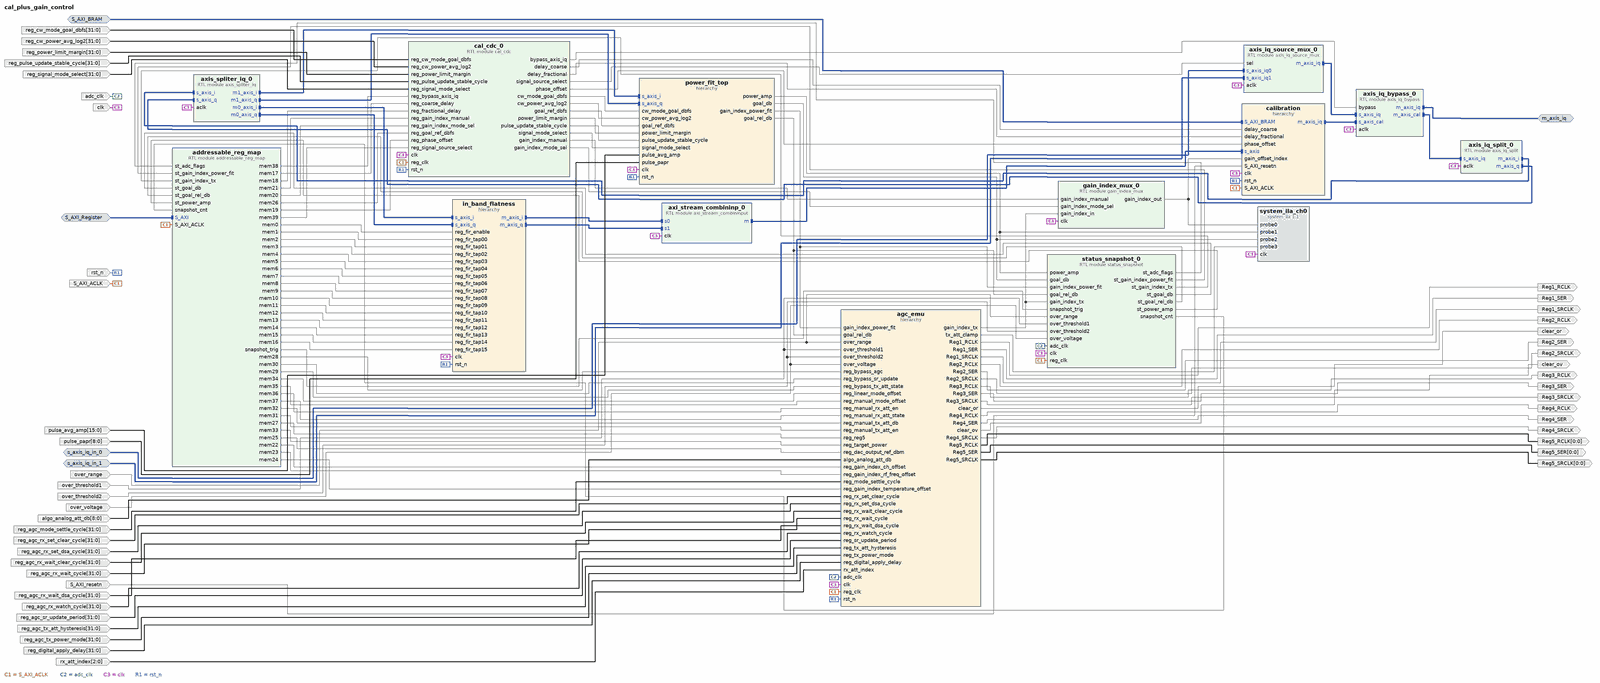
[diagram p0: block diagram of the top level, whole]
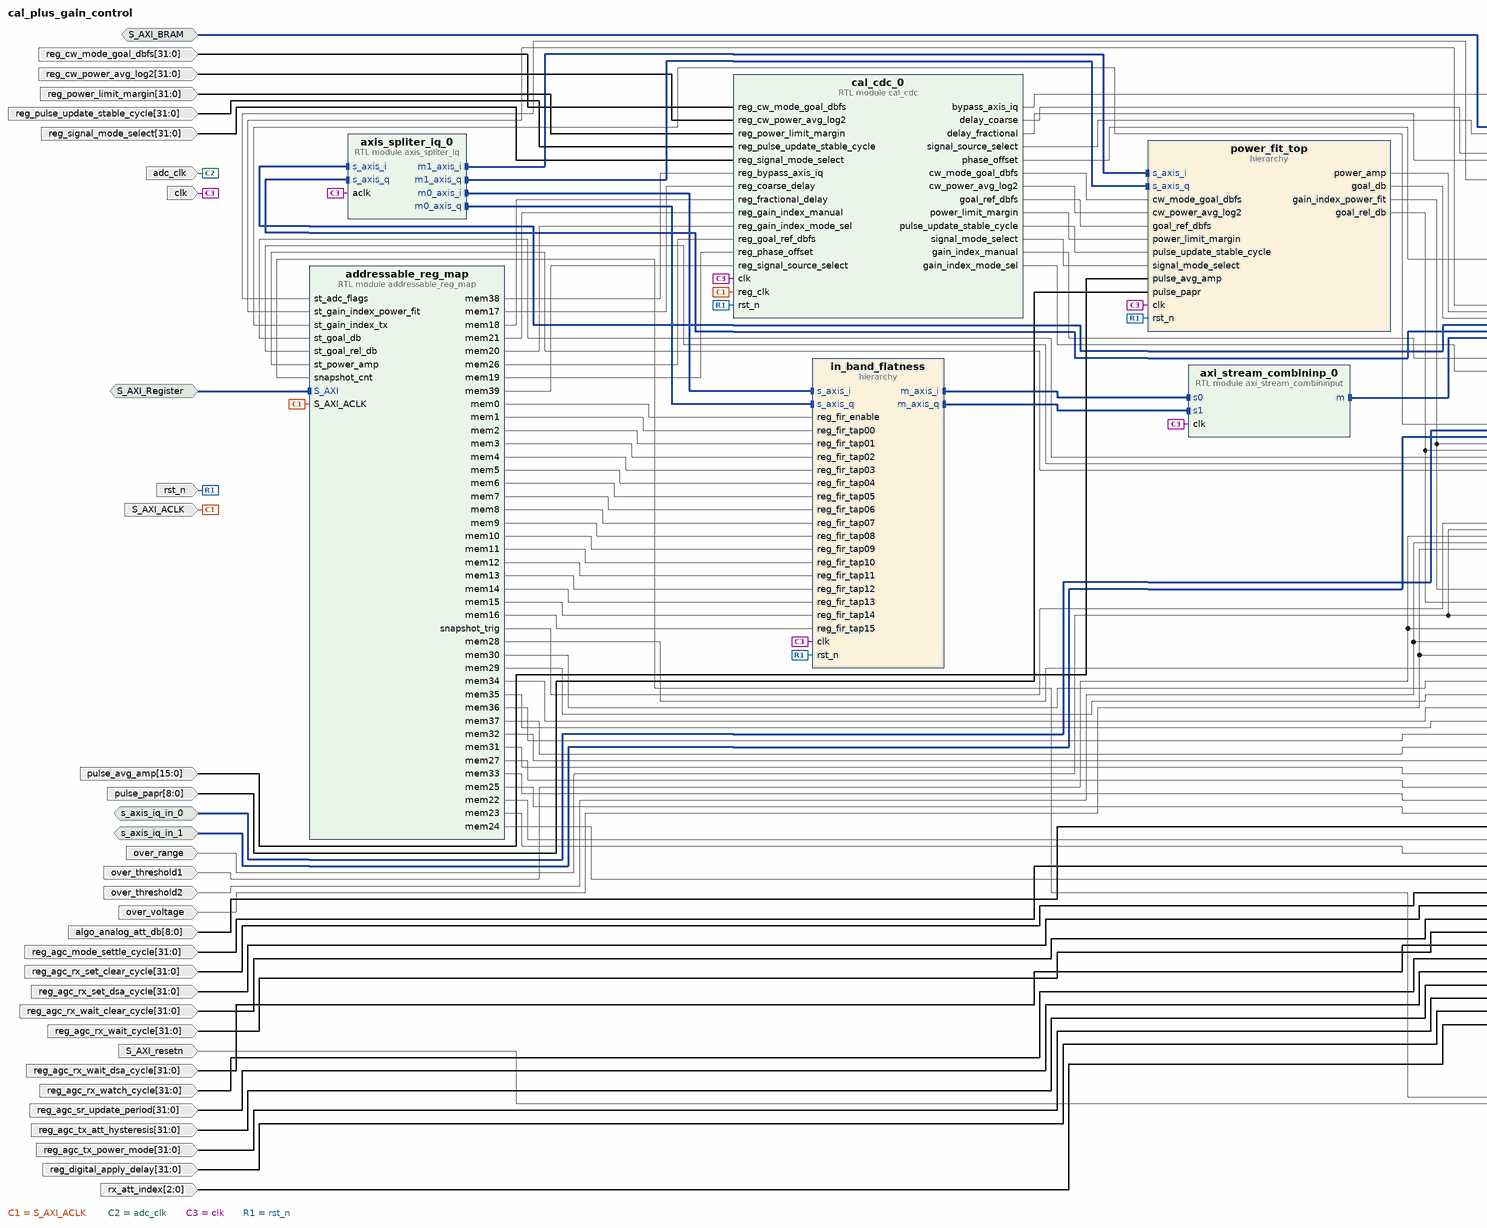
[diagram p1: block diagram of the top level, left part]
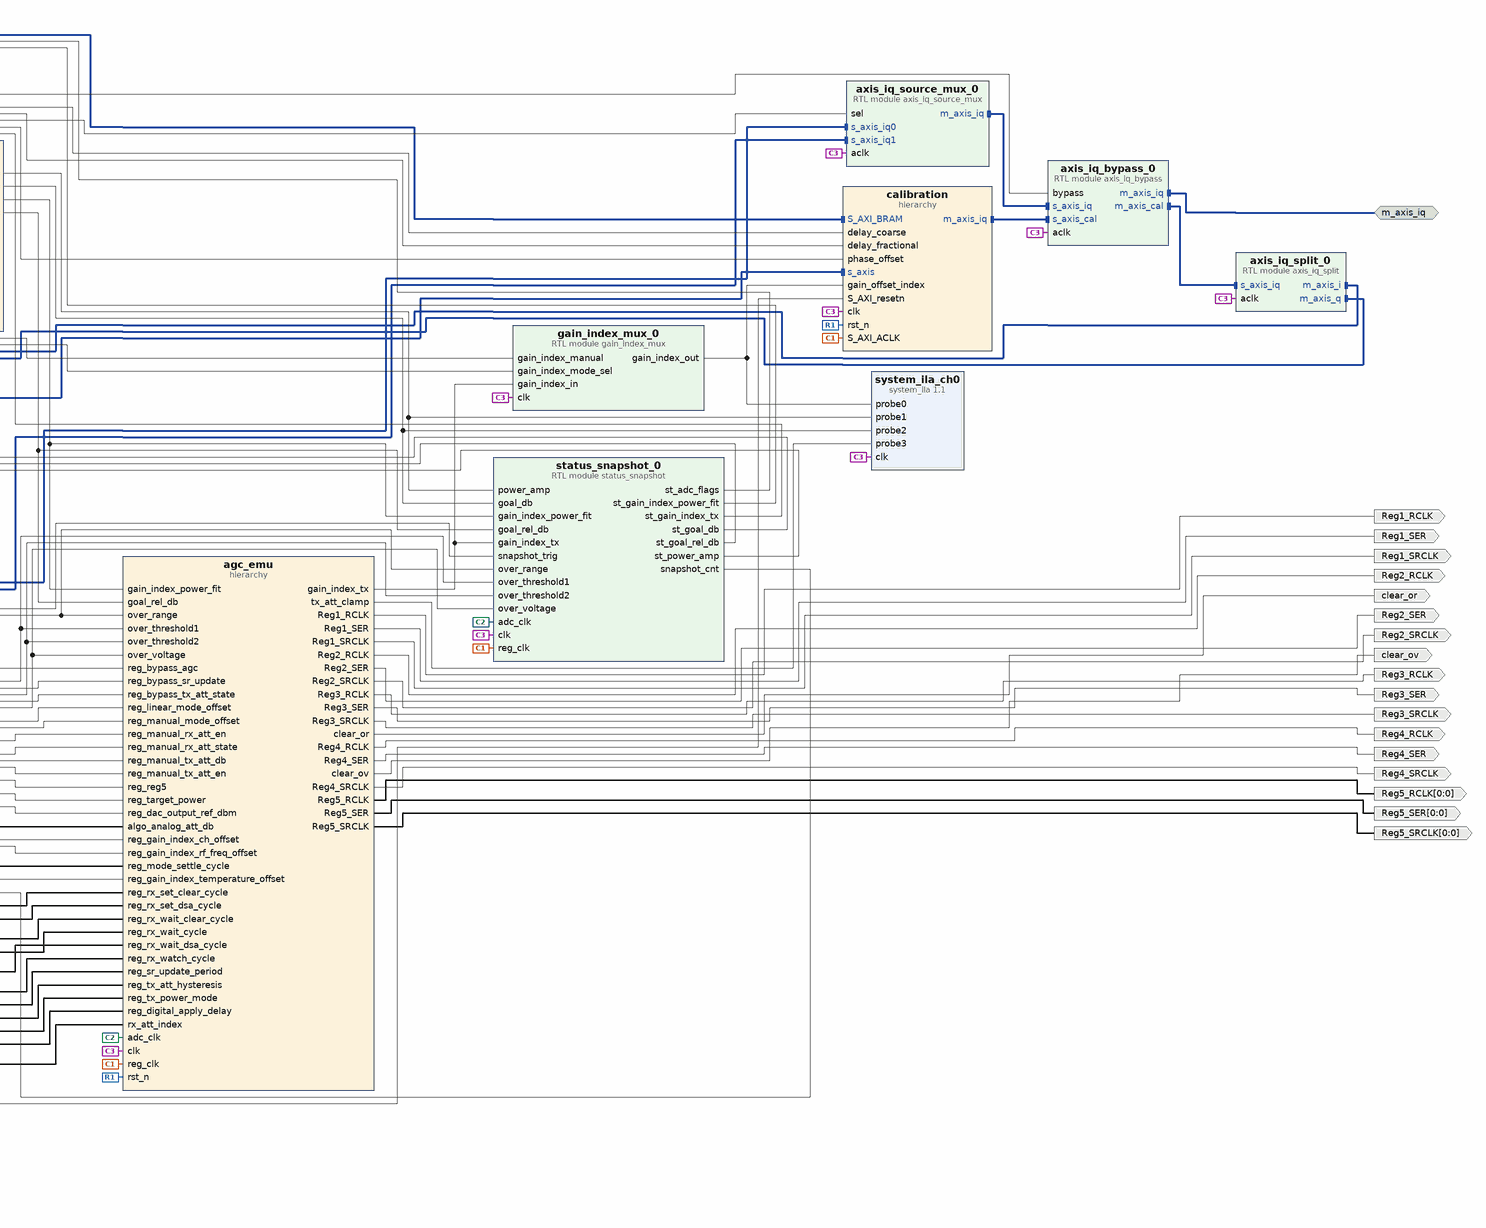
[diagram p2: block diagram of the top level, right part]
# Vivado block design cal_plus_gain_control, xczu47dr-ffvg1517-2-i, Vivado 2025.2
create_bd_design cal_plus_gain_control

create_bd_intf_port -mode Master -vlnv xilinx.com:interface:axis_rtl:1.0 m_axis_iq
set_property -dict {CONFIG.FREQ_HZ 256000000} [get_bd_intf_ports m_axis_iq]
create_bd_intf_port -mode Slave -vlnv xilinx.com:interface:aximm_rtl:1.0 S_AXI_Register
set_property -dict [list \
  CONFIG.ADDR_WIDTH 16 \
  CONFIG.ARUSER_WIDTH 0 \
  CONFIG.AWUSER_WIDTH 0 \
  CONFIG.BUSER_WIDTH 0 \
  CONFIG.DATA_WIDTH 32 \
  CONFIG.FREQ_HZ 99999901 \
  CONFIG.HAS_BRESP 1 \
  CONFIG.HAS_BURST 0 \
  CONFIG.HAS_CACHE 0 \
  CONFIG.HAS_LOCK 0 \
  CONFIG.HAS_PROT 1 \
  CONFIG.HAS_QOS 0 \
  CONFIG.HAS_REGION 0 \
  CONFIG.HAS_RRESP 1 \
  CONFIG.HAS_WSTRB 1 \
  CONFIG.ID_WIDTH 0 \
  CONFIG.NUM_READ_OUTSTANDING 1 \
  CONFIG.NUM_READ_THREADS 1 \
  CONFIG.NUM_WRITE_OUTSTANDING 1 \
  CONFIG.NUM_WRITE_THREADS 1 \
  CONFIG.PROTOCOL AXI4LITE \
  CONFIG.READ_WRITE_MODE READ_WRITE \
  CONFIG.RUSER_BITS_PER_BYTE 0 \
  CONFIG.RUSER_WIDTH 0 \
  CONFIG.WUSER_BITS_PER_BYTE 0 \
  CONFIG.WUSER_WIDTH 0 \
] [get_bd_intf_ports S_AXI_Register]
create_bd_intf_port -mode Slave -vlnv xilinx.com:interface:aximm_rtl:1.0 S_AXI_BRAM
set_property -dict [list \
  CONFIG.ADDR_WIDTH 15 \
  CONFIG.ARUSER_WIDTH 0 \
  CONFIG.AWUSER_WIDTH 0 \
  CONFIG.BUSER_WIDTH 0 \
  CONFIG.DATA_WIDTH 32 \
  CONFIG.FREQ_HZ 99999901 \
  CONFIG.HAS_BRESP 1 \
  CONFIG.HAS_BURST 1 \
  CONFIG.HAS_CACHE 1 \
  CONFIG.HAS_LOCK 1 \
  CONFIG.HAS_PROT 1 \
  CONFIG.HAS_QOS 0 \
  CONFIG.HAS_REGION 0 \
  CONFIG.HAS_RRESP 1 \
  CONFIG.HAS_WSTRB 1 \
  CONFIG.ID_WIDTH 0 \
  CONFIG.MAX_BURST_LENGTH 256 \
  CONFIG.NUM_READ_OUTSTANDING 2 \
  CONFIG.NUM_READ_THREADS 1 \
  CONFIG.NUM_WRITE_OUTSTANDING 2 \
  CONFIG.NUM_WRITE_THREADS 1 \
  CONFIG.PROTOCOL AXI4 \
  CONFIG.READ_WRITE_MODE READ_WRITE \
  CONFIG.RUSER_BITS_PER_BYTE 0 \
  CONFIG.RUSER_WIDTH 0 \
  CONFIG.SUPPORTS_NARROW_BURST 1 \
  CONFIG.WUSER_BITS_PER_BYTE 0 \
  CONFIG.WUSER_WIDTH 0 \
] [get_bd_intf_ports S_AXI_BRAM]
create_bd_intf_port -mode Slave -vlnv xilinx.com:interface:axis_rtl:1.0 s_axis_iq_in_0
set_property -dict [list \
  CONFIG.FREQ_HZ 256000000 \
  CONFIG.HAS_TKEEP 0 \
  CONFIG.HAS_TLAST 0 \
  CONFIG.HAS_TREADY 1 \
  CONFIG.HAS_TSTRB 0 \
  CONFIG.LAYERED_METADATA undef \
  CONFIG.TDATA_NUM_BYTES 20 \
  CONFIG.TDEST_WIDTH 0 \
  CONFIG.TID_WIDTH 0 \
  CONFIG.TUSER_WIDTH 0 \
] [get_bd_intf_ports s_axis_iq_in_0]
create_bd_intf_port -mode Slave -vlnv xilinx.com:interface:axis_rtl:1.0 s_axis_iq_in_1
set_property -dict [list \
  CONFIG.FREQ_HZ 256000000 \
  CONFIG.HAS_TKEEP 0 \
  CONFIG.HAS_TLAST 0 \
  CONFIG.HAS_TREADY 1 \
  CONFIG.HAS_TSTRB 0 \
  CONFIG.LAYERED_METADATA undef \
  CONFIG.TDATA_NUM_BYTES 20 \
  CONFIG.TDEST_WIDTH 0 \
  CONFIG.TID_WIDTH 0 \
  CONFIG.TUSER_WIDTH 0 \
] [get_bd_intf_ports s_axis_iq_in_1]
create_bd_port -dir I -type clk clk
set_property -dict [list \
  CONFIG.ASSOCIATED_BUSIF s_axis_iq_in_0:s_axis_iq_in_1:m_axis_iq \
  CONFIG.ASSOCIATED_RESET rst_n \
  CONFIG.FREQ_HZ 256000000 \
] [get_bd_ports clk]
create_bd_port -dir I -type rst rst_n
set_property -dict {CONFIG.POLARITY ACTIVE_LOW} [get_bd_ports rst_n]
create_bd_port -dir I -type clk S_AXI_ACLK
set_property -dict [list \
  CONFIG.ASSOCIATED_BUSIF S_AXI_Register:S_AXI_BRAM \
  CONFIG.ASSOCIATED_RESET S_AXI_resetn \
  CONFIG.FREQ_HZ 99999901 \
] [get_bd_ports S_AXI_ACLK]
create_bd_port -dir I -type rst S_AXI_resetn
set_property -dict {CONFIG.POLARITY ACTIVE_LOW} [get_bd_ports S_AXI_resetn]
create_bd_port -dir I over_voltage
create_bd_port -dir I over_range
create_bd_port -dir I over_threshold1
create_bd_port -dir I over_threshold2
create_bd_port -dir O clear_or
create_bd_port -dir O clear_ov
create_bd_port -dir O Reg1_SER
create_bd_port -dir O Reg1_SRCLK
create_bd_port -dir O Reg1_RCLK
create_bd_port -dir O Reg2_SER
create_bd_port -dir O Reg2_SRCLK
create_bd_port -dir O Reg2_RCLK
create_bd_port -dir O Reg3_SER
create_bd_port -dir O Reg3_SRCLK
create_bd_port -dir O Reg3_RCLK
create_bd_port -dir O Reg4_SER
create_bd_port -dir O Reg4_SRCLK
create_bd_port -dir O Reg4_RCLK
create_bd_port -dir O -from 0 -to 0 Reg5_SER
create_bd_port -dir O -from 0 -to 0 Reg5_SRCLK
create_bd_port -dir O -from 0 -to 0 Reg5_RCLK
create_bd_port -dir I -type clk adc_clk
set_property -dict {CONFIG.FREQ_HZ 240000000} [get_bd_ports adc_clk]
create_bd_port -dir I -from 2 -to 0 rx_att_index
create_bd_port -dir I -from 8 -to 0 algo_analog_att_db
create_bd_port -dir I -from 15 -to 0 pulse_avg_amp
create_bd_port -dir I -from 8 -to 0 pulse_papr
create_bd_port -dir I -from 31 -to 0 reg_signal_mode_select
create_bd_port -dir I -from 31 -to 0 reg_power_limit_margin
create_bd_port -dir I -from 31 -to 0 reg_cw_mode_goal_dbfs
create_bd_port -dir I -from 31 -to 0 reg_pulse_update_stable_cycle
create_bd_port -dir I -from 31 -to 0 reg_agc_tx_power_mode
create_bd_port -dir I -from 31 -to 0 reg_digital_apply_delay
create_bd_port -dir I -from 31 -to 0 reg_agc_sr_update_period
create_bd_port -dir I -from 31 -to 0 reg_agc_mode_settle_cycle
create_bd_port -dir I -from 31 -to 0 reg_agc_rx_watch_cycle
create_bd_port -dir I -from 31 -to 0 reg_agc_rx_wait_dsa_cycle
create_bd_port -dir I -from 31 -to 0 reg_agc_rx_set_dsa_cycle
create_bd_port -dir I -from 31 -to 0 reg_agc_rx_wait_cycle
create_bd_port -dir I -from 31 -to 0 reg_agc_rx_set_clear_cycle
create_bd_port -dir I -from 31 -to 0 reg_agc_rx_wait_clear_cycle
create_bd_port -dir I -from 31 -to 0 reg_cw_power_avg_log2
create_bd_port -dir I -from 31 -to 0 reg_agc_tx_att_hysteresis

create_bd_cell -type module -reference addressable_reg_map addressable_reg_map
create_bd_cell -type module -reference axi_stream_combininput axi_stream_combininp_0
create_bd_cell -type module -reference gain_index_mux gain_index_mux_0
create_bd_cell -type ip -vlnv xilinx.com:ip:system_ila:1.1 system_ila_ch0
set_property -dict [list \
  CONFIG.C_DATA_DEPTH 4096 \
  CONFIG.C_MON_TYPE NATIVE \
  CONFIG.C_NUM_OF_PROBES 4 \
  CONFIG.C_PROBE0_WIDTH 12 \
  CONFIG.C_PROBE1_WIDTH 16 \
  CONFIG.C_PROBE2_WIDTH 12 \
  CONFIG.C_PROBE3_WIDTH 2 \
  CONFIG.C_PROBE_WIDTH_PROPAGATION MANUAL \
] [get_bd_cells system_ila_ch0]
create_bd_cell -type module -reference axis_spliter_iq axis_spliter_iq_0
create_bd_cell -type module -reference axis_iq_split axis_iq_split_0
create_bd_cell -type hier agc_emu
create_bd_cell -type hier calibration
create_bd_cell -type hier in_band_flatness
create_bd_cell -type hier power_fit_top
create_bd_cell -type module -reference cal_cdc cal_cdc_0
create_bd_cell -type module -reference status_snapshot status_snapshot_0
create_bd_cell -type module -reference axis_iq_bypass axis_iq_bypass_0
create_bd_cell -type module -reference axis_iq_source_mux axis_iq_source_mux_0

# ---- hierarchy /agc_emu ----
current_bd_instance /agc_emu
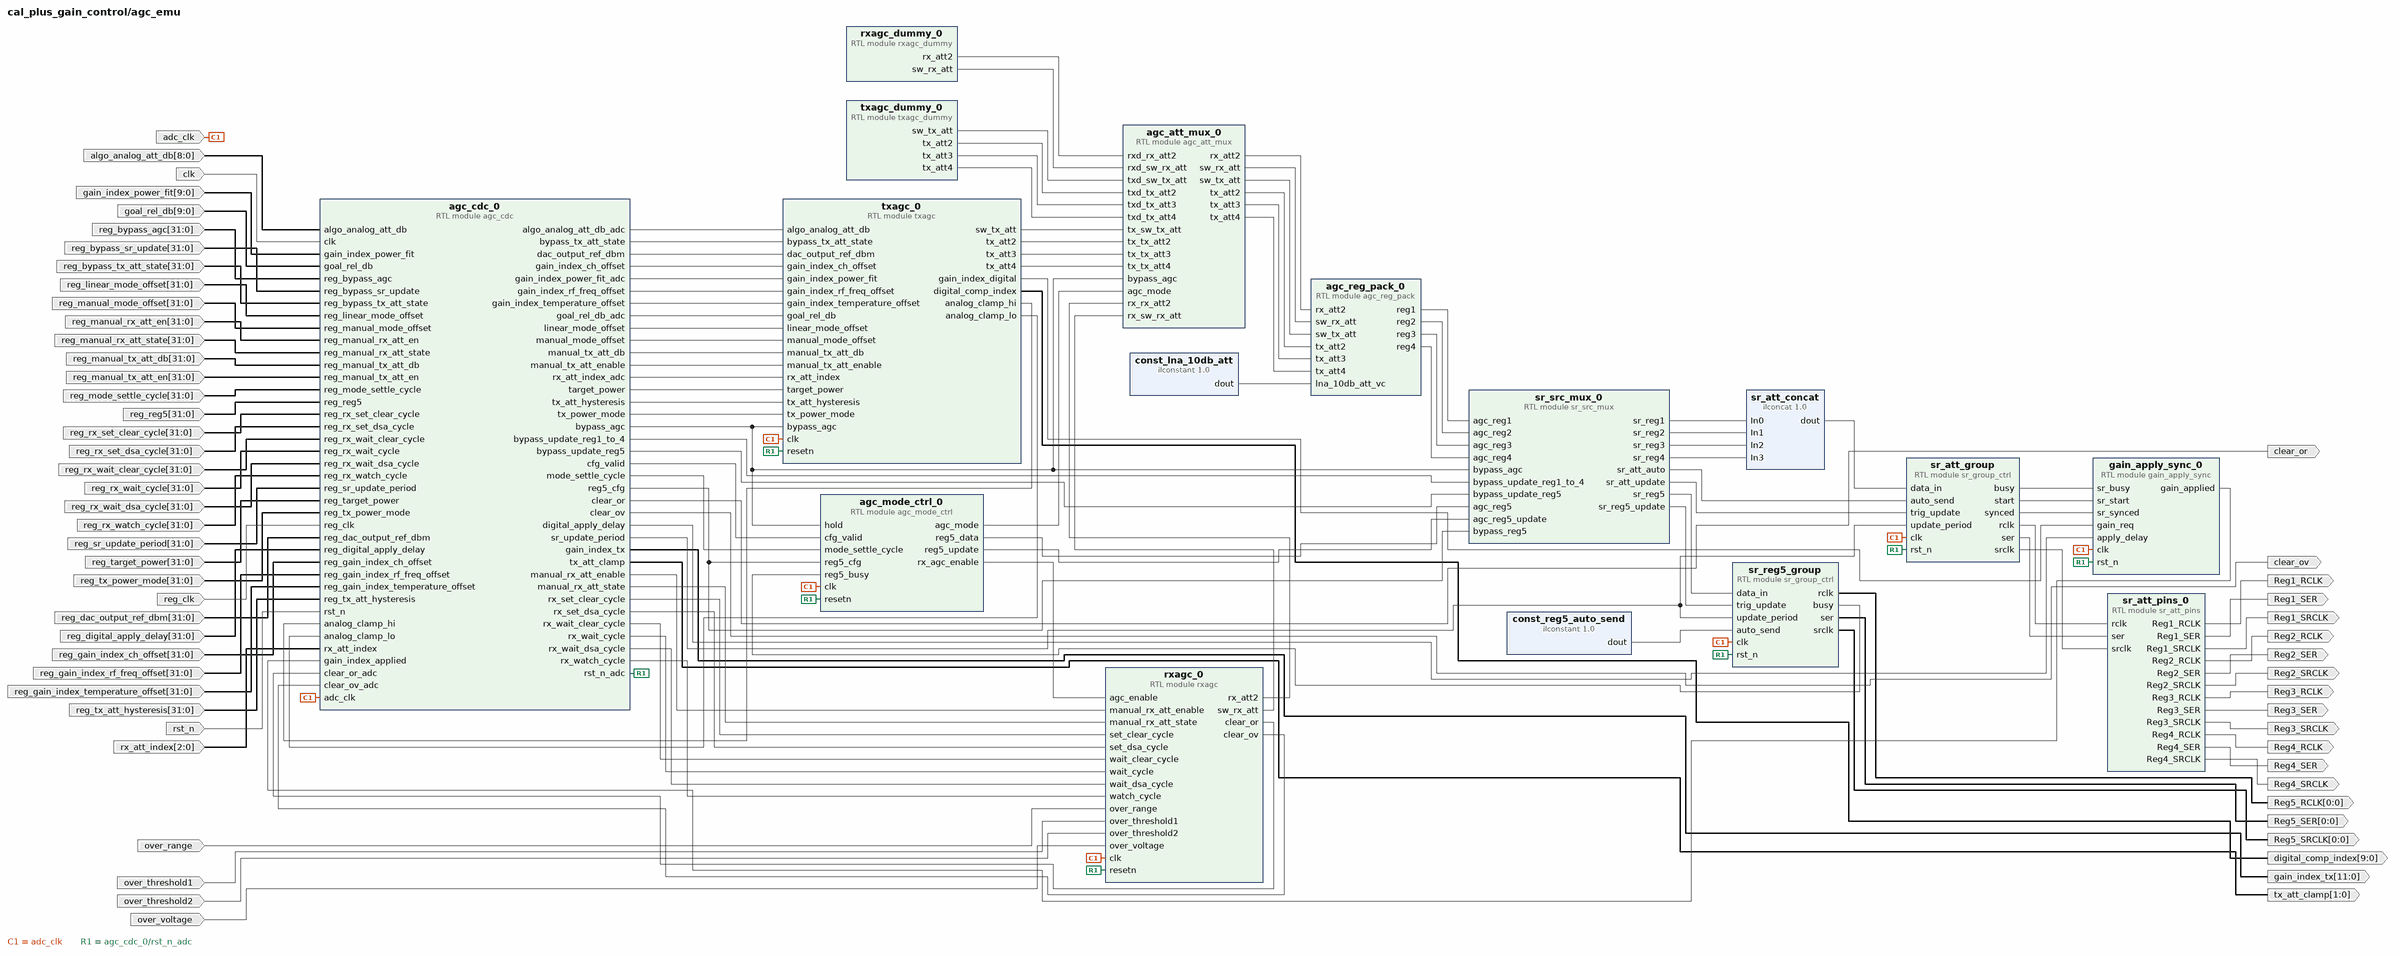
[diagram p3: block diagram inside /agc_emu]
create_bd_pin -dir I -type clk reg_clk
create_bd_pin -dir I -type clk clk
create_bd_pin -dir I -type rst rst_n
create_bd_pin -dir I -type clk adc_clk
create_bd_pin -dir I -from 31 -to 0 reg_tx_power_mode
create_bd_pin -dir I -from 31 -to 0 reg_manual_rx_att_en
create_bd_pin -dir I -from 31 -to 0 reg_manual_rx_att_state
create_bd_pin -dir I -from 31 -to 0 reg_manual_tx_att_en
create_bd_pin -dir I -from 31 -to 0 reg_manual_tx_att_db
create_bd_pin -dir I -from 31 -to 0 reg_target_power
create_bd_pin -dir I -from 31 -to 0 reg_linear_mode_offset
create_bd_pin -dir I -from 31 -to 0 reg_manual_mode_offset
create_bd_pin -dir I -from 31 -to 0 reg_reg5
create_bd_pin -dir I -from 31 -to 0 reg_bypass_agc
create_bd_pin -dir I -from 31 -to 0 reg_bypass_tx_att_state
create_bd_pin -dir I -from 31 -to 0 reg_bypass_sr_update
create_bd_pin -dir I -from 31 -to 0 reg_sr_update_period
create_bd_pin -dir I -from 31 -to 0 reg_mode_settle_cycle
create_bd_pin -dir I -from 31 -to 0 reg_rx_watch_cycle
create_bd_pin -dir I -from 31 -to 0 reg_rx_wait_dsa_cycle
create_bd_pin -dir I -from 31 -to 0 reg_rx_set_dsa_cycle
create_bd_pin -dir I -from 31 -to 0 reg_rx_wait_cycle
create_bd_pin -dir I -from 31 -to 0 reg_rx_set_clear_cycle
create_bd_pin -dir I -from 31 -to 0 reg_rx_wait_clear_cycle
create_bd_pin -dir I over_voltage
create_bd_pin -dir I over_range
create_bd_pin -dir I over_threshold1
create_bd_pin -dir I over_threshold2
create_bd_pin -dir O clear_or
create_bd_pin -dir O clear_ov
create_bd_pin -dir O -from 9 -to 0 digital_comp_index
create_bd_pin -dir O Reg1_SER
create_bd_pin -dir O Reg1_SRCLK
create_bd_pin -dir O Reg1_RCLK
create_bd_pin -dir O Reg2_SER
create_bd_pin -dir O Reg2_SRCLK
create_bd_pin -dir O Reg2_RCLK
create_bd_pin -dir O Reg3_SER
create_bd_pin -dir O Reg3_SRCLK
create_bd_pin -dir O Reg3_RCLK
create_bd_pin -dir O Reg4_SER
create_bd_pin -dir O Reg4_SRCLK
create_bd_pin -dir O Reg4_RCLK
create_bd_pin -dir O -from 0 -to 0 Reg5_SER
create_bd_pin -dir O -from 0 -to 0 Reg5_SRCLK
create_bd_pin -dir O -from 0 -to 0 Reg5_RCLK
create_bd_pin -dir I -from 31 -to 0 reg_gain_index_ch_offset
create_bd_pin -dir I -from 31 -to 0 reg_gain_index_rf_freq_offset
create_bd_pin -dir I -from 31 -to 0 reg_gain_index_temperature_offset
create_bd_pin -dir I -from 31 -to 0 reg_dac_output_ref_dbm
create_bd_pin -dir I -from 31 -to 0 reg_digital_apply_delay
create_bd_pin -dir I -from 2 -to 0 rx_att_index
create_bd_pin -dir I -from 8 -to 0 algo_analog_att_db
create_bd_pin -dir I -from 9 -to 0 gain_index_power_fit
create_bd_pin -dir I -from 9 -to 0 goal_rel_db
create_bd_pin -dir O -from 11 -to 0 gain_index_tx
create_bd_pin -dir O -from 1 -to 0 tx_att_clamp
create_bd_pin -dir I -from 31 -to 0 reg_tx_att_hysteresis

create_bd_cell -type module -reference agc_cdc agc_cdc_0
create_bd_cell -type module -reference agc_mode_ctrl agc_mode_ctrl_0
create_bd_cell -type module -reference rxagc rxagc_0
create_bd_cell -type module -reference rxagc_dummy rxagc_dummy_0
create_bd_cell -type module -reference txagc txagc_0
create_bd_cell -type module -reference txagc_dummy txagc_dummy_0
create_bd_cell -type module -reference agc_att_mux agc_att_mux_0
create_bd_cell -type module -reference agc_reg_pack agc_reg_pack_0
create_bd_cell -type module -reference sr_src_mux sr_src_mux_0
create_bd_cell -type inline_hdl -vlnv xilinx.com:inline_hdl:ilconcat:1.0 sr_att_concat
set_property -dict [list \
  CONFIG.IN0_WIDTH 8 \
  CONFIG.IN1_WIDTH 8 \
  CONFIG.IN2_WIDTH 8 \
  CONFIG.IN3_WIDTH 8 \
  CONFIG.NUM_PORTS 4 \
] [get_bd_cells sr_att_concat]
create_bd_cell -type module -reference sr_group_ctrl sr_att_group
set_property -dict {CONFIG.N_REG 4} [get_bd_cells sr_att_group]
create_bd_cell -type module -reference sr_att_pins sr_att_pins_0
create_bd_cell -type module -reference sr_group_ctrl sr_reg5_group
set_property -dict {CONFIG.N_REG 1} [get_bd_cells sr_reg5_group]
create_bd_cell -type inline_hdl -vlnv xilinx.com:inline_hdl:ilconstant:1.0 const_reg5_auto_send
set_property -dict {CONFIG.CONST_VAL 0 CONFIG.CONST_WIDTH 1} [get_bd_cells const_reg5_auto_send]
create_bd_cell -type inline_hdl -vlnv xilinx.com:inline_hdl:ilconstant:1.0 const_lna_10db_att
set_property -dict {CONFIG.CONST_VAL 1 CONFIG.CONST_WIDTH 1} [get_bd_cells const_lna_10db_att]
create_bd_cell -type module -reference gain_apply_sync gain_apply_sync_0

# ---- hierarchy /calibration ----
current_bd_instance /calibration
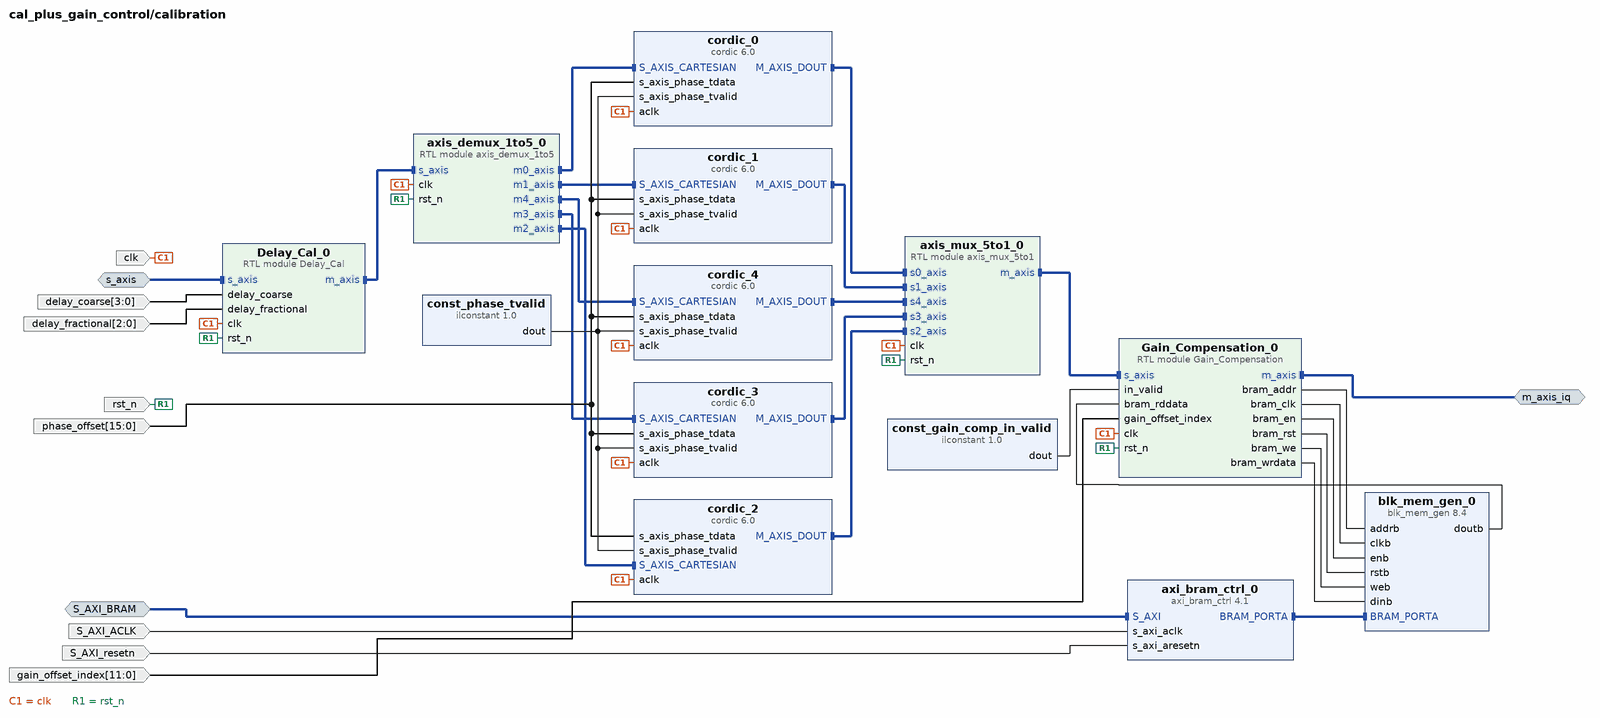
[diagram p4: block diagram inside /calibration]
create_bd_intf_pin -mode Slave -vlnv xilinx.com:interface:axis_rtl:1.0 s_axis
create_bd_intf_pin -mode Master -vlnv xilinx.com:interface:axis_rtl:1.0 m_axis_iq
create_bd_intf_pin -mode Slave -vlnv xilinx.com:interface:aximm_rtl:1.0 S_AXI_BRAM
create_bd_pin -dir I -type clk clk
create_bd_pin -dir I -type rst rst_n
create_bd_pin -dir I -from 11 -to 0 gain_offset_index
create_bd_pin -dir I -type clk S_AXI_ACLK
create_bd_pin -dir I -type rst S_AXI_resetn
create_bd_pin -dir I -from 3 -to 0 delay_coarse
create_bd_pin -dir I -from 2 -to 0 delay_fractional
create_bd_pin -dir I -from 15 -to 0 phase_offset

create_bd_cell -type module -reference Delay_Cal Delay_Cal_0
create_bd_cell -type module -reference axis_demux_1to5 axis_demux_1to5_0
create_bd_cell -type ip -vlnv xilinx.com:ip:cordic:6.0 cordic_0
set_property -dict {CONFIG.Compensation_Scaling Embedded_Multiplier CONFIG.Round_Mode Nearest_Even} [get_bd_cells cordic_0]
create_bd_cell -type ip -vlnv xilinx.com:ip:cordic:6.0 cordic_1
set_property -dict {CONFIG.Compensation_Scaling Embedded_Multiplier CONFIG.Round_Mode Nearest_Even} [get_bd_cells cordic_1]
create_bd_cell -type ip -vlnv xilinx.com:ip:cordic:6.0 cordic_2
set_property -dict {CONFIG.Compensation_Scaling Embedded_Multiplier CONFIG.Round_Mode Nearest_Even} [get_bd_cells cordic_2]
create_bd_cell -type ip -vlnv xilinx.com:ip:cordic:6.0 cordic_3
set_property -dict {CONFIG.Compensation_Scaling Embedded_Multiplier CONFIG.Round_Mode Nearest_Even} [get_bd_cells cordic_3]
create_bd_cell -type ip -vlnv xilinx.com:ip:cordic:6.0 cordic_4
set_property -dict {CONFIG.Compensation_Scaling Embedded_Multiplier CONFIG.Round_Mode Nearest_Even} [get_bd_cells cordic_4]
create_bd_cell -type module -reference axis_mux_5to1 axis_mux_5to1_0
create_bd_cell -type module -reference Gain_Compensation Gain_Compensation_0
create_bd_cell -type ip -vlnv xilinx.com:ip:blk_mem_gen:8.4 blk_mem_gen_0
set_property -dict {CONFIG.Memory_Type True_Dual_Port_RAM} [get_bd_cells blk_mem_gen_0]
create_bd_cell -type ip -vlnv xilinx.com:ip:axi_bram_ctrl:4.1 axi_bram_ctrl_0
set_property -dict {CONFIG.SINGLE_PORT_BRAM 1} [get_bd_cells axi_bram_ctrl_0]
create_bd_cell -type inline_hdl -vlnv xilinx.com:inline_hdl:ilconstant:1.0 const_phase_tvalid
set_property -dict {CONFIG.CONST_VAL 1 CONFIG.CONST_WIDTH 1} [get_bd_cells const_phase_tvalid]
create_bd_cell -type inline_hdl -vlnv xilinx.com:inline_hdl:ilconstant:1.0 const_gain_comp_in_valid

# ---- hierarchy /in_band_flatness ----
current_bd_instance /in_band_flatness
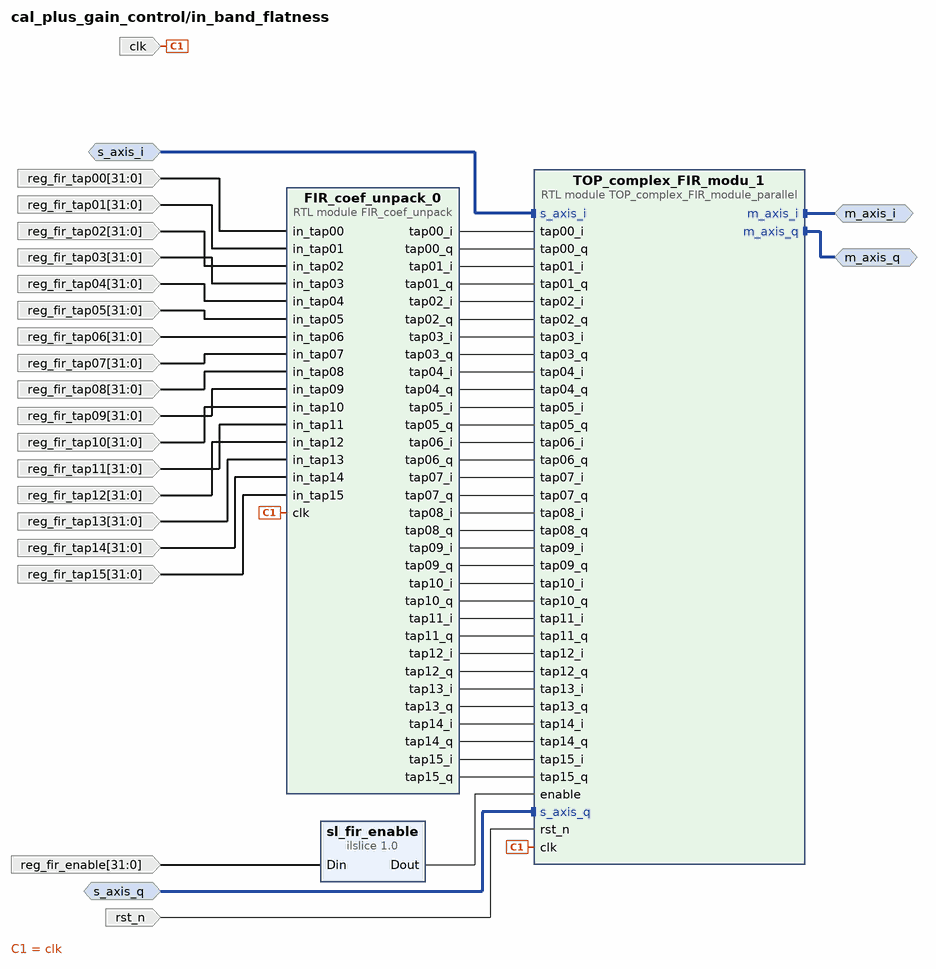
[diagram p5: block diagram inside /in_band_flatness]
create_bd_intf_pin -mode Master -vlnv xilinx.com:interface:axis_rtl:1.0 m_axis_i
create_bd_intf_pin -mode Master -vlnv xilinx.com:interface:axis_rtl:1.0 m_axis_q
create_bd_intf_pin -mode Slave -vlnv xilinx.com:interface:axis_rtl:1.0 s_axis_i
create_bd_intf_pin -mode Slave -vlnv xilinx.com:interface:axis_rtl:1.0 s_axis_q
create_bd_pin -dir I -from 31 -to 0 reg_fir_enable
create_bd_pin -dir I -type clk clk
create_bd_pin -dir I -from 31 -to 0 reg_fir_tap00
create_bd_pin -dir I -from 31 -to 0 reg_fir_tap01
create_bd_pin -dir I -from 31 -to 0 reg_fir_tap02
create_bd_pin -dir I -from 31 -to 0 reg_fir_tap03
create_bd_pin -dir I -from 31 -to 0 reg_fir_tap04
create_bd_pin -dir I -from 31 -to 0 reg_fir_tap05
create_bd_pin -dir I -from 31 -to 0 reg_fir_tap06
create_bd_pin -dir I -from 31 -to 0 reg_fir_tap07
create_bd_pin -dir I -from 31 -to 0 reg_fir_tap08
create_bd_pin -dir I -from 31 -to 0 reg_fir_tap09
create_bd_pin -dir I -from 31 -to 0 reg_fir_tap10
create_bd_pin -dir I -from 31 -to 0 reg_fir_tap11
create_bd_pin -dir I -from 31 -to 0 reg_fir_tap12
create_bd_pin -dir I -from 31 -to 0 reg_fir_tap13
create_bd_pin -dir I -from 31 -to 0 reg_fir_tap14
create_bd_pin -dir I -from 31 -to 0 reg_fir_tap15
create_bd_pin -dir I -type rst rst_n

create_bd_cell -type inline_hdl -vlnv xilinx.com:inline_hdl:ilslice:1.0 sl_fir_enable
set_property -dict {CONFIG.DIN_FROM 0 CONFIG.DIN_TO 0 CONFIG.DIN_WIDTH 32} [get_bd_cells sl_fir_enable]
create_bd_cell -type module -reference FIR_coef_unpack FIR_coef_unpack_0
create_bd_cell -type module -reference TOP_complex_FIR_module_parallel TOP_complex_FIR_modu_1

# ---- hierarchy /power_fit_top ----
current_bd_instance /power_fit_top
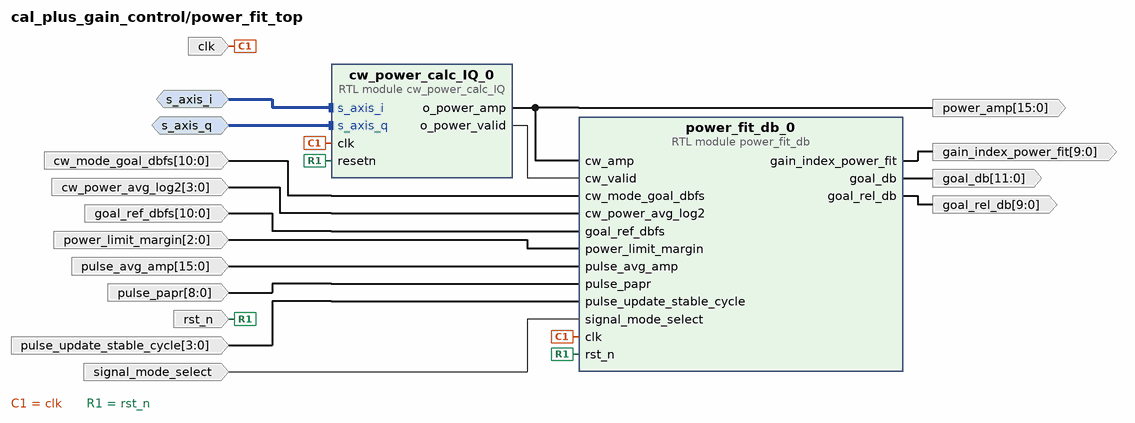
[diagram p6: block diagram inside /power_fit_top]
create_bd_intf_pin -mode Slave -vlnv xilinx.com:interface:axis_rtl:1.0 s_axis_i
create_bd_intf_pin -mode Slave -vlnv xilinx.com:interface:axis_rtl:1.0 s_axis_q
create_bd_pin -dir I -type clk clk
create_bd_pin -dir I -type rst rst_n
create_bd_pin -dir O -from 15 -to 0 power_amp
create_bd_pin -dir O -from 9 -to 0 gain_index_power_fit
create_bd_pin -dir I signal_mode_select
create_bd_pin -dir I -from 2 -to 0 power_limit_margin
create_bd_pin -dir I -from 15 -to 0 pulse_avg_amp
create_bd_pin -dir I -from 8 -to 0 pulse_papr
create_bd_pin -dir O -from 9 -to 0 goal_rel_db
create_bd_pin -dir I -from 10 -to 0 cw_mode_goal_dbfs
create_bd_pin -dir I -from 10 -to 0 goal_ref_dbfs
create_bd_pin -dir I -from 3 -to 0 pulse_update_stable_cycle
create_bd_pin -dir O -from 11 -to 0 goal_db
create_bd_pin -dir I -from 3 -to 0 cw_power_avg_log2

create_bd_cell -type module -reference cw_power_calc_IQ cw_power_calc_IQ_0
create_bd_cell -type module -reference power_fit_db power_fit_db_0

# ---- connections ----

current_bd_instance /agc_emu
connect_bd_net [get_bd_pins adc_clk] \
  [get_bd_pins agc_mode_ctrl_0/clk] [get_bd_pins gain_apply_sync_0/clk] [get_bd_pins rxagc_0/clk] \
  [get_bd_pins sr_att_group/clk] [get_bd_pins sr_reg5_group/clk] [get_bd_pins agc_cdc_0/adc_clk] [get_bd_pins txagc_0/clk]
connect_bd_net [get_bd_pins agc_att_mux_0/rx_att2] [get_bd_pins agc_reg_pack_0/rx_att2]
connect_bd_net [get_bd_pins agc_att_mux_0/sw_rx_att] [get_bd_pins agc_reg_pack_0/sw_rx_att]
connect_bd_net [get_bd_pins agc_att_mux_0/sw_tx_att] [get_bd_pins agc_reg_pack_0/sw_tx_att]
connect_bd_net [get_bd_pins agc_att_mux_0/tx_att2] [get_bd_pins agc_reg_pack_0/tx_att2]
connect_bd_net [get_bd_pins agc_att_mux_0/tx_att3] [get_bd_pins agc_reg_pack_0/tx_att3]
connect_bd_net [get_bd_pins agc_att_mux_0/tx_att4] [get_bd_pins agc_reg_pack_0/tx_att4]
connect_bd_net [get_bd_pins agc_cdc_0/algo_analog_att_db_adc] [get_bd_pins txagc_0/algo_analog_att_db]
connect_bd_net [get_bd_pins agc_cdc_0/bypass_agc] \
  [get_bd_pins agc_att_mux_0/bypass_agc] [get_bd_pins agc_mode_ctrl_0/hold] [get_bd_pins sr_src_mux_0/bypass_agc] \
  [get_bd_pins txagc_0/bypass_agc]
connect_bd_net [get_bd_pins agc_cdc_0/bypass_tx_att_state] [get_bd_pins txagc_0/bypass_tx_att_state]
connect_bd_net [get_bd_pins agc_cdc_0/bypass_update_reg1_to_4] [get_bd_pins sr_src_mux_0/bypass_update_reg1_to_4]
connect_bd_net [get_bd_pins agc_cdc_0/bypass_update_reg5] [get_bd_pins sr_src_mux_0/bypass_update_reg5]
connect_bd_net [get_bd_pins agc_cdc_0/cfg_valid] [get_bd_pins agc_mode_ctrl_0/cfg_valid]
connect_bd_net [get_bd_pins agc_cdc_0/clear_or] [get_bd_pins clear_or]
connect_bd_net [get_bd_pins agc_cdc_0/clear_ov] [get_bd_pins clear_ov]
connect_bd_net [get_bd_pins agc_cdc_0/dac_output_ref_dbm] [get_bd_pins txagc_0/dac_output_ref_dbm]
connect_bd_net [get_bd_pins agc_cdc_0/digital_apply_delay] [get_bd_pins gain_apply_sync_0/apply_delay]
connect_bd_net [get_bd_pins agc_cdc_0/gain_index_ch_offset] [get_bd_pins txagc_0/gain_index_ch_offset]
connect_bd_net [get_bd_pins agc_cdc_0/gain_index_power_fit_adc] [get_bd_pins txagc_0/gain_index_power_fit]
connect_bd_net [get_bd_pins agc_cdc_0/gain_index_rf_freq_offset] [get_bd_pins txagc_0/gain_index_rf_freq_offset]
connect_bd_net [get_bd_pins agc_cdc_0/gain_index_temperature_offset] [get_bd_pins txagc_0/gain_index_temperature_offset]
connect_bd_net [get_bd_pins agc_cdc_0/gain_index_tx] [get_bd_pins gain_index_tx]
connect_bd_net [get_bd_pins agc_cdc_0/goal_rel_db_adc] [get_bd_pins txagc_0/goal_rel_db]
connect_bd_net [get_bd_pins agc_cdc_0/linear_mode_offset] [get_bd_pins txagc_0/linear_mode_offset]
connect_bd_net [get_bd_pins agc_cdc_0/manual_mode_offset] [get_bd_pins txagc_0/manual_mode_offset]
connect_bd_net [get_bd_pins agc_cdc_0/manual_rx_att_enable] [get_bd_pins rxagc_0/manual_rx_att_enable]
connect_bd_net [get_bd_pins agc_cdc_0/manual_rx_att_state] [get_bd_pins rxagc_0/manual_rx_att_state]
connect_bd_net [get_bd_pins agc_cdc_0/manual_tx_att_db] [get_bd_pins txagc_0/manual_tx_att_db]
connect_bd_net [get_bd_pins agc_cdc_0/manual_tx_att_enable] [get_bd_pins txagc_0/manual_tx_att_enable]
connect_bd_net [get_bd_pins agc_cdc_0/mode_settle_cycle] [get_bd_pins agc_mode_ctrl_0/mode_settle_cycle]
connect_bd_net [get_bd_pins agc_cdc_0/reg5_cfg] [get_bd_pins agc_mode_ctrl_0/reg5_cfg] [get_bd_pins sr_src_mux_0/bypass_reg5]
connect_bd_net [get_bd_pins agc_cdc_0/rst_n_adc] \
  [get_bd_pins agc_mode_ctrl_0/resetn] [get_bd_pins gain_apply_sync_0/rst_n] [get_bd_pins rxagc_0/resetn] \
  [get_bd_pins sr_att_group/rst_n] [get_bd_pins sr_reg5_group/rst_n] [get_bd_pins txagc_0/resetn]
connect_bd_net [get_bd_pins agc_cdc_0/rx_att_index_adc] [get_bd_pins txagc_0/rx_att_index]
connect_bd_net [get_bd_pins agc_cdc_0/rx_set_clear_cycle] [get_bd_pins rxagc_0/set_clear_cycle]
connect_bd_net [get_bd_pins agc_cdc_0/rx_set_dsa_cycle] [get_bd_pins rxagc_0/set_dsa_cycle]
connect_bd_net [get_bd_pins agc_cdc_0/rx_wait_clear_cycle] [get_bd_pins rxagc_0/wait_clear_cycle]
connect_bd_net [get_bd_pins agc_cdc_0/rx_wait_cycle] [get_bd_pins rxagc_0/wait_cycle]
connect_bd_net [get_bd_pins agc_cdc_0/rx_wait_dsa_cycle] [get_bd_pins rxagc_0/wait_dsa_cycle]
connect_bd_net [get_bd_pins agc_cdc_0/rx_watch_cycle] [get_bd_pins rxagc_0/watch_cycle]
connect_bd_net [get_bd_pins agc_cdc_0/sr_update_period] [get_bd_pins sr_att_group/update_period] [get_bd_pins sr_reg5_group/update_period]
connect_bd_net [get_bd_pins agc_cdc_0/target_power] [get_bd_pins txagc_0/target_power]
connect_bd_net [get_bd_pins agc_cdc_0/tx_att_clamp] [get_bd_pins tx_att_clamp]
connect_bd_net [get_bd_pins agc_cdc_0/tx_att_hysteresis] [get_bd_pins txagc_0/tx_att_hysteresis]
connect_bd_net [get_bd_pins agc_cdc_0/tx_power_mode] [get_bd_pins txagc_0/tx_power_mode]
connect_bd_net [get_bd_pins agc_mode_ctrl_0/agc_mode] [get_bd_pins agc_att_mux_0/agc_mode]
connect_bd_net [get_bd_pins agc_mode_ctrl_0/reg5_data] [get_bd_pins sr_src_mux_0/agc_reg5]
connect_bd_net [get_bd_pins agc_mode_ctrl_0/reg5_update] [get_bd_pins sr_src_mux_0/agc_reg5_update]
connect_bd_net [get_bd_pins agc_mode_ctrl_0/rx_agc_enable] [get_bd_pins rxagc_0/agc_enable]
connect_bd_net [get_bd_pins agc_reg_pack_0/reg1] [get_bd_pins sr_src_mux_0/agc_reg1]
connect_bd_net [get_bd_pins agc_reg_pack_0/reg2] [get_bd_pins sr_src_mux_0/agc_reg2]
connect_bd_net [get_bd_pins agc_reg_pack_0/reg3] [get_bd_pins sr_src_mux_0/agc_reg3]
connect_bd_net [get_bd_pins agc_reg_pack_0/reg4] [get_bd_pins sr_src_mux_0/agc_reg4]
connect_bd_net [get_bd_pins algo_analog_att_db] [get_bd_pins agc_cdc_0/algo_analog_att_db]
connect_bd_net [get_bd_pins clk] [get_bd_pins agc_cdc_0/clk]
connect_bd_net [get_bd_pins const_lna_10db_att/dout] [get_bd_pins agc_reg_pack_0/lna_10db_att_vc]
connect_bd_net [get_bd_pins const_reg5_auto_send/dout] [get_bd_pins sr_reg5_group/auto_send]
connect_bd_net [get_bd_pins gain_apply_sync_0/gain_applied] [get_bd_pins agc_cdc_0/gain_index_applied]
connect_bd_net [get_bd_pins gain_index_power_fit] [get_bd_pins agc_cdc_0/gain_index_power_fit]
connect_bd_net [get_bd_pins goal_rel_db] [get_bd_pins agc_cdc_0/goal_rel_db]
connect_bd_net [get_bd_pins over_range] [get_bd_pins rxagc_0/over_range]
connect_bd_net -net over_threshold1_1 [get_bd_pins over_threshold1] [get_bd_pins rxagc_0/over_threshold1]
connect_bd_net -net over_threshold2_1 [get_bd_pins over_threshold2] [get_bd_pins rxagc_0/over_threshold2]
connect_bd_net [get_bd_pins over_voltage] [get_bd_pins rxagc_0/over_voltage]
connect_bd_net -net reg_agc_bypass_agc [get_bd_pins reg_bypass_agc] [get_bd_pins agc_cdc_0/reg_bypass_agc]
connect_bd_net -net reg_agc_bypass_sr_update [get_bd_pins reg_bypass_sr_update] [get_bd_pins agc_cdc_0/reg_bypass_sr_update]
connect_bd_net -net reg_agc_bypass_tx_att_state [get_bd_pins reg_bypass_tx_att_state] [get_bd_pins agc_cdc_0/reg_bypass_tx_att_state]
connect_bd_net -net reg_agc_linear_mode_offset [get_bd_pins reg_linear_mode_offset] [get_bd_pins agc_cdc_0/reg_linear_mode_offset]
connect_bd_net -net reg_agc_manual_mode_offset [get_bd_pins reg_manual_mode_offset] [get_bd_pins agc_cdc_0/reg_manual_mode_offset]
connect_bd_net -net reg_agc_manual_rx_att_en [get_bd_pins reg_manual_rx_att_en] [get_bd_pins agc_cdc_0/reg_manual_rx_att_en]
connect_bd_net -net reg_agc_manual_rx_att_state [get_bd_pins reg_manual_rx_att_state] [get_bd_pins agc_cdc_0/reg_manual_rx_att_state]
connect_bd_net -net reg_agc_manual_tx_att_db [get_bd_pins reg_manual_tx_att_db] [get_bd_pins agc_cdc_0/reg_manual_tx_att_db]
connect_bd_net -net reg_agc_manual_tx_att_en [get_bd_pins reg_manual_tx_att_en] [get_bd_pins agc_cdc_0/reg_manual_tx_att_en]
connect_bd_net -net reg_agc_mode_settle_cycle [get_bd_pins reg_mode_settle_cycle] [get_bd_pins agc_cdc_0/reg_mode_settle_cycle]
connect_bd_net -net reg_agc_reg5 [get_bd_pins reg_reg5] [get_bd_pins agc_cdc_0/reg_reg5]
connect_bd_net -net reg_agc_rx_set_clear_cycle [get_bd_pins reg_rx_set_clear_cycle] [get_bd_pins agc_cdc_0/reg_rx_set_clear_cycle]
connect_bd_net -net reg_agc_rx_set_dsa_cycle [get_bd_pins reg_rx_set_dsa_cycle] [get_bd_pins agc_cdc_0/reg_rx_set_dsa_cycle]
connect_bd_net -net reg_agc_rx_wait_clear_cycle [get_bd_pins reg_rx_wait_clear_cycle] [get_bd_pins agc_cdc_0/reg_rx_wait_clear_cycle]
connect_bd_net -net reg_agc_rx_wait_cycle [get_bd_pins reg_rx_wait_cycle] [get_bd_pins agc_cdc_0/reg_rx_wait_cycle]
connect_bd_net -net reg_agc_rx_wait_dsa_cycle [get_bd_pins reg_rx_wait_dsa_cycle] [get_bd_pins agc_cdc_0/reg_rx_wait_dsa_cycle]
connect_bd_net -net reg_agc_rx_watch_cycle [get_bd_pins reg_rx_watch_cycle] [get_bd_pins agc_cdc_0/reg_rx_watch_cycle]
connect_bd_net -net reg_agc_sr_update_period [get_bd_pins reg_sr_update_period] [get_bd_pins agc_cdc_0/reg_sr_update_period]
connect_bd_net -net reg_agc_target_power [get_bd_pins reg_target_power] [get_bd_pins agc_cdc_0/reg_target_power]
connect_bd_net -net reg_agc_tx_power_mode [get_bd_pins reg_tx_power_mode] [get_bd_pins agc_cdc_0/reg_tx_power_mode]
connect_bd_net [get_bd_pins reg_clk] [get_bd_pins agc_cdc_0/reg_clk]
connect_bd_net [get_bd_pins reg_dac_output_ref_dbm] [get_bd_pins agc_cdc_0/reg_dac_output_ref_dbm]
connect_bd_net [get_bd_pins reg_digital_apply_delay] [get_bd_pins agc_cdc_0/reg_digital_apply_delay]
connect_bd_net [get_bd_pins reg_gain_index_ch_offset] [get_bd_pins agc_cdc_0/reg_gain_index_ch_offset]
connect_bd_net [get_bd_pins reg_gain_index_rf_freq_offset] [get_bd_pins agc_cdc_0/reg_gain_index_rf_freq_offset]
connect_bd_net [get_bd_pins reg_gain_index_temperature_offset] [get_bd_pins agc_cdc_0/reg_gain_index_temperature_offset]
connect_bd_net [get_bd_pins reg_tx_att_hysteresis] [get_bd_pins agc_cdc_0/reg_tx_att_hysteresis]
connect_bd_net [get_bd_pins rst_n] [get_bd_pins agc_cdc_0/rst_n]
connect_bd_net [get_bd_pins rx_att_index] [get_bd_pins agc_cdc_0/rx_att_index]
connect_bd_net [get_bd_pins rxagc_0/clear_or] [get_bd_pins agc_cdc_0/clear_or_adc]
connect_bd_net [get_bd_pins rxagc_0/clear_ov] [get_bd_pins agc_cdc_0/clear_ov_adc]
connect_bd_net [get_bd_pins rxagc_0/rx_att2] [get_bd_pins agc_att_mux_0/rx_rx_att2]
connect_bd_net [get_bd_pins rxagc_0/sw_rx_att] [get_bd_pins agc_att_mux_0/rx_sw_rx_att]
connect_bd_net [get_bd_pins rxagc_dummy_0/rx_att2] [get_bd_pins agc_att_mux_0/rxd_rx_att2]
connect_bd_net [get_bd_pins rxagc_dummy_0/sw_rx_att] [get_bd_pins agc_att_mux_0/rxd_sw_rx_att]
connect_bd_net [get_bd_pins sr_att_concat/dout] [get_bd_pins sr_att_group/data_in]
connect_bd_net [get_bd_pins sr_att_group/busy] [get_bd_pins gain_apply_sync_0/sr_busy]
connect_bd_net [get_bd_pins sr_att_group/rclk] [get_bd_pins sr_att_pins_0/rclk]
connect_bd_net [get_bd_pins sr_att_group/ser] [get_bd_pins sr_att_pins_0/ser]
connect_bd_net [get_bd_pins sr_att_group/srclk] [get_bd_pins sr_att_pins_0/srclk]
connect_bd_net [get_bd_pins sr_att_group/start] [get_bd_pins gain_apply_sync_0/sr_start]
connect_bd_net [get_bd_pins sr_att_group/synced] [get_bd_pins gain_apply_sync_0/sr_synced]
connect_bd_net [get_bd_pins sr_att_pins_0/Reg1_RCLK] [get_bd_pins Reg1_RCLK]
connect_bd_net [get_bd_pins sr_att_pins_0/Reg1_SER] [get_bd_pins Reg1_SER]
connect_bd_net [get_bd_pins sr_att_pins_0/Reg1_SRCLK] [get_bd_pins Reg1_SRCLK]
connect_bd_net [get_bd_pins sr_att_pins_0/Reg2_RCLK] [get_bd_pins Reg2_RCLK]
connect_bd_net [get_bd_pins sr_att_pins_0/Reg2_SER] [get_bd_pins Reg2_SER]
connect_bd_net [get_bd_pins sr_att_pins_0/Reg2_SRCLK] [get_bd_pins Reg2_SRCLK]
connect_bd_net [get_bd_pins sr_att_pins_0/Reg3_RCLK] [get_bd_pins Reg3_RCLK]
connect_bd_net [get_bd_pins sr_att_pins_0/Reg3_SER] [get_bd_pins Reg3_SER]
connect_bd_net [get_bd_pins sr_att_pins_0/Reg3_SRCLK] [get_bd_pins Reg3_SRCLK]
connect_bd_net [get_bd_pins sr_att_pins_0/Reg4_RCLK] [get_bd_pins Reg4_RCLK]
connect_bd_net [get_bd_pins sr_att_pins_0/Reg4_SER] [get_bd_pins Reg4_SER]
connect_bd_net [get_bd_pins sr_att_pins_0/Reg4_SRCLK] [get_bd_pins Reg4_SRCLK]
connect_bd_net [get_bd_pins sr_reg5_group/busy] [get_bd_pins agc_mode_ctrl_0/reg5_busy]
connect_bd_net [get_bd_pins sr_reg5_group/rclk] [get_bd_pins Reg5_RCLK]
connect_bd_net [get_bd_pins sr_reg5_group/ser] [get_bd_pins Reg5_SER]
connect_bd_net [get_bd_pins sr_reg5_group/srclk] [get_bd_pins Reg5_SRCLK]
connect_bd_net [get_bd_pins sr_src_mux_0/sr_att_auto] [get_bd_pins sr_att_group/auto_send]
connect_bd_net [get_bd_pins sr_src_mux_0/sr_att_update] [get_bd_pins sr_att_group/trig_update]
connect_bd_net [get_bd_pins sr_src_mux_0/sr_reg1] [get_bd_pins sr_att_concat/In0]
connect_bd_net [get_bd_pins sr_src_mux_0/sr_reg2] [get_bd_pins sr_att_concat/In1]
connect_bd_net [get_bd_pins sr_src_mux_0/sr_reg3] [get_bd_pins sr_att_concat/In2]
connect_bd_net [get_bd_pins sr_src_mux_0/sr_reg4] [get_bd_pins sr_att_concat/In3]
connect_bd_net [get_bd_pins sr_src_mux_0/sr_reg5] [get_bd_pins sr_reg5_group/data_in]
connect_bd_net [get_bd_pins sr_src_mux_0/sr_reg5_update] [get_bd_pins sr_reg5_group/trig_update]
connect_bd_net [get_bd_pins txagc_0/analog_clamp_hi] [get_bd_pins agc_cdc_0/analog_clamp_hi]
connect_bd_net [get_bd_pins txagc_0/analog_clamp_lo] [get_bd_pins agc_cdc_0/analog_clamp_lo]
connect_bd_net [get_bd_pins txagc_0/digital_comp_index] [get_bd_pins digital_comp_index]
connect_bd_net [get_bd_pins txagc_0/gain_index_digital] [get_bd_pins gain_apply_sync_0/gain_req]
connect_bd_net [get_bd_pins txagc_0/sw_tx_att] [get_bd_pins agc_att_mux_0/tx_sw_tx_att]
connect_bd_net [get_bd_pins txagc_0/tx_att2] [get_bd_pins agc_att_mux_0/tx_tx_att2]
connect_bd_net [get_bd_pins txagc_0/tx_att3] [get_bd_pins agc_att_mux_0/tx_tx_att3]
connect_bd_net [get_bd_pins txagc_0/tx_att4] [get_bd_pins agc_att_mux_0/tx_tx_att4]
connect_bd_net [get_bd_pins txagc_dummy_0/sw_tx_att] [get_bd_pins agc_att_mux_0/txd_sw_tx_att]
connect_bd_net [get_bd_pins txagc_dummy_0/tx_att2] [get_bd_pins agc_att_mux_0/txd_tx_att2]
connect_bd_net [get_bd_pins txagc_dummy_0/tx_att3] [get_bd_pins agc_att_mux_0/txd_tx_att3]
connect_bd_net [get_bd_pins txagc_dummy_0/tx_att4] [get_bd_pins agc_att_mux_0/txd_tx_att4]

current_bd_instance /calibration
connect_bd_intf_net [get_bd_intf_pins Delay_Cal_0/m_axis] [get_bd_intf_pins axis_demux_1to5_0/s_axis]
connect_bd_intf_net [get_bd_intf_pins S_AXI_BRAM] [get_bd_intf_pins axi_bram_ctrl_0/S_AXI]
connect_bd_intf_net [get_bd_intf_pins axi_bram_ctrl_0/BRAM_PORTA] [get_bd_intf_pins blk_mem_gen_0/BRAM_PORTA]
connect_bd_intf_net -intf_net axi_stream_combininp_0_m [get_bd_intf_pins s_axis] [get_bd_intf_pins Delay_Cal_0/s_axis]
connect_bd_intf_net [get_bd_intf_pins axis_demux_1to5_0/m0_axis] [get_bd_intf_pins cordic_0/S_AXIS_CARTESIAN]
connect_bd_intf_net [get_bd_intf_pins axis_demux_1to5_0/m1_axis] [get_bd_intf_pins cordic_1/S_AXIS_CARTESIAN]
connect_bd_intf_net [get_bd_intf_pins axis_demux_1to5_0/m2_axis] [get_bd_intf_pins cordic_2/S_AXIS_CARTESIAN]
connect_bd_intf_net [get_bd_intf_pins axis_demux_1to5_0/m3_axis] [get_bd_intf_pins cordic_3/S_AXIS_CARTESIAN]
connect_bd_intf_net [get_bd_intf_pins axis_demux_1to5_0/m4_axis] [get_bd_intf_pins cordic_4/S_AXIS_CARTESIAN]
connect_bd_intf_net [get_bd_intf_pins axis_mux_5to1_0/m_axis] [get_bd_intf_pins Gain_Compensation_0/s_axis]
connect_bd_intf_net [get_bd_intf_pins axis_mux_5to1_0/s0_axis] [get_bd_intf_pins cordic_0/M_AXIS_DOUT]
connect_bd_intf_net [get_bd_intf_pins axis_mux_5to1_0/s1_axis] [get_bd_intf_pins cordic_1/M_AXIS_DOUT]
connect_bd_intf_net [get_bd_intf_pins axis_mux_5to1_0/s2_axis] [get_bd_intf_pins cordic_2/M_AXIS_DOUT]
connect_bd_intf_net [get_bd_intf_pins axis_mux_5to1_0/s3_axis] [get_bd_intf_pins cordic_3/M_AXIS_DOUT]
connect_bd_intf_net [get_bd_intf_pins axis_mux_5to1_0/s4_axis] [get_bd_intf_pins cordic_4/M_AXIS_DOUT]
connect_bd_intf_net -intf_net tmp_hier_m_axis_iq [get_bd_intf_pins m_axis_iq] [get_bd_intf_pins Gain_Compensation_0/m_axis]
connect_bd_net [get_bd_pins Gain_Compensation_0/bram_addr] [get_bd_pins blk_mem_gen_0/addrb]
connect_bd_net [get_bd_pins Gain_Compensation_0/bram_clk] [get_bd_pins blk_mem_gen_0/clkb]
connect_bd_net [get_bd_pins Gain_Compensation_0/bram_en] [get_bd_pins blk_mem_gen_0/enb]
connect_bd_net [get_bd_pins Gain_Compensation_0/bram_rst] [get_bd_pins blk_mem_gen_0/rstb]
connect_bd_net [get_bd_pins Gain_Compensation_0/bram_we] [get_bd_pins blk_mem_gen_0/web]
connect_bd_net [get_bd_pins Gain_Compensation_0/bram_wrdata] [get_bd_pins blk_mem_gen_0/dinb]
connect_bd_net [get_bd_pins S_AXI_ACLK] [get_bd_pins axi_bram_ctrl_0/s_axi_aclk]
connect_bd_net [get_bd_pins S_AXI_resetn] [get_bd_pins axi_bram_ctrl_0/s_axi_aresetn]
connect_bd_net [get_bd_pins blk_mem_gen_0/doutb] [get_bd_pins Gain_Compensation_0/bram_rddata]
connect_bd_net [get_bd_pins clk] \
  [get_bd_pins cordic_0/aclk] [get_bd_pins cordic_1/aclk] [get_bd_pins cordic_2/aclk] [get_bd_pins cordic_3/aclk] \
  [get_bd_pins cordic_4/aclk] [get_bd_pins Delay_Cal_0/clk] [get_bd_pins Gain_Compensation_0/clk] \
  [get_bd_pins axis_demux_1to5_0/clk] [get_bd_pins axis_mux_5to1_0/clk]
connect_bd_net -net coarse_delay [get_bd_pins delay_coarse] [get_bd_pins Delay_Cal_0/delay_coarse]
connect_bd_net -net fractional_delay [get_bd_pins delay_fractional] [get_bd_pins Delay_Cal_0/delay_fractional]
connect_bd_net -net gain_index_mux_0_gain_index_out [get_bd_pins gain_offset_index] [get_bd_pins Gain_Compensation_0/gain_offset_index]
connect_bd_net -net ilconstant_0_dout [get_bd_pins const_gain_comp_in_valid/dout] [get_bd_pins Gain_Compensation_0/in_valid]
connect_bd_net [get_bd_pins phase_offset] \
  [get_bd_pins cordic_0/s_axis_phase_tdata] [get_bd_pins cordic_1/s_axis_phase_tdata] \
  [get_bd_pins cordic_2/s_axis_phase_tdata] [get_bd_pins cordic_3/s_axis_phase_tdata] \
  [get_bd_pins cordic_4/s_axis_phase_tdata]
connect_bd_net -net phase_tvalid [get_bd_pins const_phase_tvalid/dout] \
  [get_bd_pins cordic_0/s_axis_phase_tvalid] [get_bd_pins cordic_1/s_axis_phase_tvalid] \
  [get_bd_pins cordic_2/s_axis_phase_tvalid] [get_bd_pins cordic_3/s_axis_phase_tvalid] \
  [get_bd_pins cordic_4/s_axis_phase_tvalid]
connect_bd_net [get_bd_pins rst_n] \
  [get_bd_pins Delay_Cal_0/rst_n] [get_bd_pins Gain_Compensation_0/rst_n] [get_bd_pins axis_demux_1to5_0/rst_n] \
  [get_bd_pins axis_mux_5to1_0/rst_n]

current_bd_instance /in_band_flatness
connect_bd_intf_net [get_bd_intf_pins m_axis_i] [get_bd_intf_pins TOP_complex_FIR_modu_1/m_axis_i]
connect_bd_intf_net [get_bd_intf_pins m_axis_q] [get_bd_intf_pins TOP_complex_FIR_modu_1/m_axis_q]
connect_bd_intf_net -intf_net axis_spliter_iq_0_m0_axis_i [get_bd_intf_pins s_axis_i] [get_bd_intf_pins TOP_complex_FIR_modu_1/s_axis_i]
connect_bd_intf_net -intf_net axis_spliter_iq_0_m0_axis_q [get_bd_intf_pins s_axis_q] [get_bd_intf_pins TOP_complex_FIR_modu_1/s_axis_q]
connect_bd_net [get_bd_pins FIR_coef_unpack_0/tap00_i] [get_bd_pins TOP_complex_FIR_modu_1/tap00_i]
connect_bd_net [get_bd_pins FIR_coef_unpack_0/tap00_q] [get_bd_pins TOP_complex_FIR_modu_1/tap00_q]
connect_bd_net [get_bd_pins FIR_coef_unpack_0/tap01_i] [get_bd_pins TOP_complex_FIR_modu_1/tap01_i]
connect_bd_net [get_bd_pins FIR_coef_unpack_0/tap01_q] [get_bd_pins TOP_complex_FIR_modu_1/tap01_q]
connect_bd_net [get_bd_pins FIR_coef_unpack_0/tap02_i] [get_bd_pins TOP_complex_FIR_modu_1/tap02_i]
connect_bd_net [get_bd_pins FIR_coef_unpack_0/tap02_q] [get_bd_pins TOP_complex_FIR_modu_1/tap02_q]
connect_bd_net [get_bd_pins FIR_coef_unpack_0/tap03_i] [get_bd_pins TOP_complex_FIR_modu_1/tap03_i]
connect_bd_net [get_bd_pins FIR_coef_unpack_0/tap03_q] [get_bd_pins TOP_complex_FIR_modu_1/tap03_q]
connect_bd_net [get_bd_pins FIR_coef_unpack_0/tap04_i] [get_bd_pins TOP_complex_FIR_modu_1/tap04_i]
connect_bd_net [get_bd_pins FIR_coef_unpack_0/tap04_q] [get_bd_pins TOP_complex_FIR_modu_1/tap04_q]
connect_bd_net [get_bd_pins FIR_coef_unpack_0/tap05_i] [get_bd_pins TOP_complex_FIR_modu_1/tap05_i]
connect_bd_net [get_bd_pins FIR_coef_unpack_0/tap05_q] [get_bd_pins TOP_complex_FIR_modu_1/tap05_q]
connect_bd_net [get_bd_pins FIR_coef_unpack_0/tap06_i] [get_bd_pins TOP_complex_FIR_modu_1/tap06_i]
connect_bd_net [get_bd_pins FIR_coef_unpack_0/tap06_q] [get_bd_pins TOP_complex_FIR_modu_1/tap06_q]
connect_bd_net [get_bd_pins FIR_coef_unpack_0/tap07_i] [get_bd_pins TOP_complex_FIR_modu_1/tap07_i]
connect_bd_net [get_bd_pins FIR_coef_unpack_0/tap07_q] [get_bd_pins TOP_complex_FIR_modu_1/tap07_q]
connect_bd_net [get_bd_pins FIR_coef_unpack_0/tap08_i] [get_bd_pins TOP_complex_FIR_modu_1/tap08_i]
connect_bd_net [get_bd_pins FIR_coef_unpack_0/tap08_q] [get_bd_pins TOP_complex_FIR_modu_1/tap08_q]
connect_bd_net [get_bd_pins FIR_coef_unpack_0/tap09_i] [get_bd_pins TOP_complex_FIR_modu_1/tap09_i]
connect_bd_net [get_bd_pins FIR_coef_unpack_0/tap09_q] [get_bd_pins TOP_complex_FIR_modu_1/tap09_q]
connect_bd_net [get_bd_pins FIR_coef_unpack_0/tap10_i] [get_bd_pins TOP_complex_FIR_modu_1/tap10_i]
connect_bd_net [get_bd_pins FIR_coef_unpack_0/tap10_q] [get_bd_pins TOP_complex_FIR_modu_1/tap10_q]
connect_bd_net [get_bd_pins FIR_coef_unpack_0/tap11_i] [get_bd_pins TOP_complex_FIR_modu_1/tap11_i]
connect_bd_net [get_bd_pins FIR_coef_unpack_0/tap11_q] [get_bd_pins TOP_complex_FIR_modu_1/tap11_q]
connect_bd_net [get_bd_pins FIR_coef_unpack_0/tap12_i] [get_bd_pins TOP_complex_FIR_modu_1/tap12_i]
connect_bd_net [get_bd_pins FIR_coef_unpack_0/tap12_q] [get_bd_pins TOP_complex_FIR_modu_1/tap12_q]
connect_bd_net [get_bd_pins FIR_coef_unpack_0/tap13_i] [get_bd_pins TOP_complex_FIR_modu_1/tap13_i]
connect_bd_net [get_bd_pins FIR_coef_unpack_0/tap13_q] [get_bd_pins TOP_complex_FIR_modu_1/tap13_q]
connect_bd_net [get_bd_pins FIR_coef_unpack_0/tap14_i] [get_bd_pins TOP_complex_FIR_modu_1/tap14_i]
connect_bd_net [get_bd_pins FIR_coef_unpack_0/tap14_q] [get_bd_pins TOP_complex_FIR_modu_1/tap14_q]
connect_bd_net [get_bd_pins FIR_coef_unpack_0/tap15_i] [get_bd_pins TOP_complex_FIR_modu_1/tap15_i]
connect_bd_net [get_bd_pins FIR_coef_unpack_0/tap15_q] [get_bd_pins TOP_complex_FIR_modu_1/tap15_q]
connect_bd_net [get_bd_pins clk] [get_bd_pins FIR_coef_unpack_0/clk] [get_bd_pins TOP_complex_FIR_modu_1/clk]
connect_bd_net -net fir_enable [get_bd_pins sl_fir_enable/Dout] [get_bd_pins TOP_complex_FIR_modu_1/enable]
connect_bd_net [get_bd_pins reg_fir_enable] [get_bd_pins sl_fir_enable/Din]
connect_bd_net [get_bd_pins reg_fir_tap00] [get_bd_pins FIR_coef_unpack_0/in_tap00]
connect_bd_net [get_bd_pins reg_fir_tap01] [get_bd_pins FIR_coef_unpack_0/in_tap01]
connect_bd_net [get_bd_pins reg_fir_tap02] [get_bd_pins FIR_coef_unpack_0/in_tap02]
connect_bd_net [get_bd_pins reg_fir_tap03] [get_bd_pins FIR_coef_unpack_0/in_tap03]
connect_bd_net [get_bd_pins reg_fir_tap04] [get_bd_pins FIR_coef_unpack_0/in_tap04]
connect_bd_net [get_bd_pins reg_fir_tap05] [get_bd_pins FIR_coef_unpack_0/in_tap05]
connect_bd_net [get_bd_pins reg_fir_tap06] [get_bd_pins FIR_coef_unpack_0/in_tap06]
connect_bd_net [get_bd_pins reg_fir_tap07] [get_bd_pins FIR_coef_unpack_0/in_tap07]
connect_bd_net [get_bd_pins reg_fir_tap08] [get_bd_pins FIR_coef_unpack_0/in_tap08]
connect_bd_net [get_bd_pins reg_fir_tap09] [get_bd_pins FIR_coef_unpack_0/in_tap09]
connect_bd_net [get_bd_pins reg_fir_tap10] [get_bd_pins FIR_coef_unpack_0/in_tap10]
connect_bd_net [get_bd_pins reg_fir_tap11] [get_bd_pins FIR_coef_unpack_0/in_tap11]
connect_bd_net [get_bd_pins reg_fir_tap12] [get_bd_pins FIR_coef_unpack_0/in_tap12]
connect_bd_net [get_bd_pins reg_fir_tap13] [get_bd_pins FIR_coef_unpack_0/in_tap13]
connect_bd_net [get_bd_pins reg_fir_tap14] [get_bd_pins FIR_coef_unpack_0/in_tap14]
connect_bd_net [get_bd_pins reg_fir_tap15] [get_bd_pins FIR_coef_unpack_0/in_tap15]
connect_bd_net [get_bd_pins rst_n] [get_bd_pins TOP_complex_FIR_modu_1/rst_n]

current_bd_instance /power_fit_top
connect_bd_intf_net -intf_net axis_spliter_iq_0_m1_axis_i [get_bd_intf_pins s_axis_i] [get_bd_intf_pins cw_power_calc_IQ_0/s_axis_i]
connect_bd_intf_net -intf_net axis_spliter_iq_0_m1_axis_q [get_bd_intf_pins s_axis_q] [get_bd_intf_pins cw_power_calc_IQ_0/s_axis_q]
connect_bd_net [get_bd_pins clk] [get_bd_pins cw_power_calc_IQ_0/clk] [get_bd_pins power_fit_db_0/clk]
connect_bd_net [get_bd_pins cw_mode_goal_dbfs] [get_bd_pins power_fit_db_0/cw_mode_goal_dbfs]
connect_bd_net -net cw_power_avg_log2_1 [get_bd_pins cw_power_avg_log2] [get_bd_pins power_fit_db_0/cw_power_avg_log2]
connect_bd_net [get_bd_pins cw_power_calc_IQ_0/o_power_amp] [get_bd_pins power_amp] [get_bd_pins power_fit_db_0/cw_amp]
connect_bd_net [get_bd_pins cw_power_calc_IQ_0/o_power_valid] [get_bd_pins power_fit_db_0/cw_valid]
connect_bd_net [get_bd_pins goal_ref_dbfs] [get_bd_pins power_fit_db_0/goal_ref_dbfs]
connect_bd_net [get_bd_pins power_fit_db_0/gain_index_power_fit] [get_bd_pins gain_index_power_fit]
connect_bd_net [get_bd_pins power_fit_db_0/goal_db] [get_bd_pins goal_db]
connect_bd_net [get_bd_pins power_fit_db_0/goal_rel_db] [get_bd_pins goal_rel_db]
connect_bd_net [get_bd_pins power_limit_margin] [get_bd_pins power_fit_db_0/power_limit_margin]
connect_bd_net [get_bd_pins pulse_avg_amp] [get_bd_pins power_fit_db_0/pulse_avg_amp]
connect_bd_net [get_bd_pins pulse_papr] [get_bd_pins power_fit_db_0/pulse_papr]
connect_bd_net [get_bd_pins pulse_update_stable_cycle] [get_bd_pins power_fit_db_0/pulse_update_stable_cycle]
connect_bd_net [get_bd_pins rst_n] [get_bd_pins cw_power_calc_IQ_0/resetn] [get_bd_pins power_fit_db_0/rst_n]
connect_bd_net [get_bd_pins signal_mode_select] [get_bd_pins power_fit_db_0/signal_mode_select]

current_bd_instance /
connect_bd_intf_net [get_bd_intf_ports S_AXI_BRAM] [get_bd_intf_pins calibration/S_AXI_BRAM]
connect_bd_intf_net [get_bd_intf_ports S_AXI_Register] [get_bd_intf_pins addressable_reg_map/S_AXI]
connect_bd_intf_net -intf_net TOP_complex_FIR_modu_1_m_axis_i [get_bd_intf_pins in_band_flatness/m_axis_i] [get_bd_intf_pins axi_stream_combininp_0/s0]
connect_bd_intf_net -intf_net TOP_complex_FIR_modu_1_m_axis_q [get_bd_intf_pins in_band_flatness/m_axis_q] [get_bd_intf_pins axi_stream_combininp_0/s1]
connect_bd_intf_net [get_bd_intf_pins axi_stream_combininp_0/m] [get_bd_intf_pins calibration/s_axis]
connect_bd_intf_net [get_bd_intf_pins axis_spliter_iq_0/m0_axis_i] [get_bd_intf_pins in_band_flatness/s_axis_i]
connect_bd_intf_net [get_bd_intf_pins axis_spliter_iq_0/m0_axis_q] [get_bd_intf_pins in_band_flatness/s_axis_q]
connect_bd_intf_net [get_bd_intf_pins axis_spliter_iq_0/m1_axis_i] [get_bd_intf_pins power_fit_top/s_axis_i]
connect_bd_intf_net [get_bd_intf_pins axis_spliter_iq_0/m1_axis_q] [get_bd_intf_pins power_fit_top/s_axis_q]
connect_bd_intf_net -intf_net bypass_m_axis_cal [get_bd_intf_pins axis_iq_bypass_0/m_axis_cal] [get_bd_intf_pins axis_iq_split_0/s_axis_iq]
connect_bd_intf_net [get_bd_intf_pins calibration/m_axis_iq] [get_bd_intf_pins axis_iq_bypass_0/s_axis_cal]
connect_bd_intf_net [get_bd_intf_pins axis_iq_bypass_0/m_axis_iq] [get_bd_intf_ports m_axis_iq]
connect_bd_intf_net [get_bd_intf_pins axis_iq_split_0/m_axis_i] [get_bd_intf_pins axis_spliter_iq_0/s_axis_i]
connect_bd_intf_net [get_bd_intf_ports s_axis_iq_in_0] [get_bd_intf_pins axis_iq_source_mux_0/s_axis_iq0]
connect_bd_intf_net [get_bd_intf_ports s_axis_iq_in_1] [get_bd_intf_pins axis_iq_source_mux_0/s_axis_iq1]
connect_bd_intf_net [get_bd_intf_pins axis_iq_split_0/m_axis_q] [get_bd_intf_pins axis_spliter_iq_0/s_axis_q]
connect_bd_intf_net -intf_net source_mux_m_axis_iq [get_bd_intf_pins axis_iq_source_mux_0/m_axis_iq] [get_bd_intf_pins axis_iq_bypass_0/s_axis_iq]
connect_bd_net [get_bd_ports S_AXI_ACLK] \
  [get_bd_pins agc_emu/reg_clk] [get_bd_pins calibration/S_AXI_ACLK] [get_bd_pins status_snapshot_0/reg_clk] \
  [get_bd_pins addressable_reg_map/S_AXI_ACLK] [get_bd_pins cal_cdc_0/reg_clk]
connect_bd_net [get_bd_ports S_AXI_resetn] [get_bd_pins calibration/S_AXI_resetn]
connect_bd_net [get_bd_ports adc_clk] [get_bd_pins agc_emu/adc_clk] [get_bd_pins status_snapshot_0/adc_clk]
connect_bd_net -net agc_emu_0_Reg1_RCLK [get_bd_pins agc_emu/Reg1_RCLK] [get_bd_ports Reg1_RCLK]
connect_bd_net -net agc_emu_0_Reg1_SER [get_bd_pins agc_emu/Reg1_SER] [get_bd_ports Reg1_SER]
connect_bd_net -net agc_emu_0_Reg1_SRCLK [get_bd_pins agc_emu/Reg1_SRCLK] [get_bd_ports Reg1_SRCLK]
connect_bd_net -net agc_emu_0_Reg2_RCLK [get_bd_pins agc_emu/Reg2_RCLK] [get_bd_ports Reg2_RCLK]
connect_bd_net -net agc_emu_0_Reg2_SER [get_bd_pins agc_emu/Reg2_SER] [get_bd_ports Reg2_SER]
connect_bd_net -net agc_emu_0_Reg2_SRCLK [get_bd_pins agc_emu/Reg2_SRCLK] [get_bd_ports Reg2_SRCLK]
connect_bd_net -net agc_emu_0_Reg3_RCLK [get_bd_pins agc_emu/Reg3_RCLK] [get_bd_ports Reg3_RCLK]
connect_bd_net -net agc_emu_0_Reg3_SER [get_bd_pins agc_emu/Reg3_SER] [get_bd_ports Reg3_SER]
connect_bd_net -net agc_emu_0_Reg3_SRCLK [get_bd_pins agc_emu/Reg3_SRCLK] [get_bd_ports Reg3_SRCLK]
connect_bd_net -net agc_emu_0_Reg4_RCLK [get_bd_pins agc_emu/Reg4_RCLK] [get_bd_ports Reg4_RCLK]
connect_bd_net -net agc_emu_0_Reg4_SER [get_bd_pins agc_emu/Reg4_SER] [get_bd_ports Reg4_SER]
connect_bd_net -net agc_emu_0_Reg4_SRCLK [get_bd_pins agc_emu/Reg4_SRCLK] [get_bd_ports Reg4_SRCLK]
connect_bd_net -net agc_emu_0_Reg5_RCLK [get_bd_pins agc_emu/Reg5_RCLK] [get_bd_ports Reg5_RCLK]
connect_bd_net -net agc_emu_0_Reg5_SER [get_bd_pins agc_emu/Reg5_SER] [get_bd_ports Reg5_SER]
connect_bd_net -net agc_emu_0_Reg5_SRCLK [get_bd_pins agc_emu/Reg5_SRCLK] [get_bd_ports Reg5_SRCLK]
connect_bd_net -net agc_emu_0_clear_or [get_bd_pins agc_emu/clear_or] [get_bd_ports clear_or]
connect_bd_net -net agc_emu_0_clear_ov [get_bd_pins agc_emu/clear_ov] [get_bd_ports clear_ov]
connect_bd_net [get_bd_pins agc_emu/gain_index_tx] [get_bd_pins gain_index_mux_0/gain_index_in] [get_bd_pins status_snapshot_0/gain_index_tx]
connect_bd_net [get_bd_pins agc_emu/tx_att_clamp] [get_bd_pins system_ila_ch0/probe3]
connect_bd_net [get_bd_ports algo_analog_att_db] [get_bd_pins agc_emu/algo_analog_att_db]
connect_bd_net -net bypass_axis_iq [get_bd_pins cal_cdc_0/bypass_axis_iq] [get_bd_pins axis_iq_bypass_0/bypass]
connect_bd_net [get_bd_pins cal_cdc_0/cw_mode_goal_dbfs] [get_bd_pins power_fit_top/cw_mode_goal_dbfs]
connect_bd_net [get_bd_pins cal_cdc_0/cw_power_avg_log2] [get_bd_pins power_fit_top/cw_power_avg_log2]
connect_bd_net [get_bd_pins cal_cdc_0/delay_coarse] [get_bd_pins calibration/delay_coarse]
connect_bd_net [get_bd_pins cal_cdc_0/delay_fractional] [get_bd_pins calibration/delay_fractional]
connect_bd_net [get_bd_pins cal_cdc_0/gain_index_manual] [get_bd_pins gain_index_mux_0/gain_index_manual]
connect_bd_net [get_bd_pins cal_cdc_0/goal_ref_dbfs] [get_bd_pins power_fit_top/goal_ref_dbfs]
connect_bd_net [get_bd_pins cal_cdc_0/phase_offset] [get_bd_pins calibration/phase_offset]
connect_bd_net [get_bd_pins cal_cdc_0/power_limit_margin] [get_bd_pins power_fit_top/power_limit_margin]
connect_bd_net [get_bd_pins cal_cdc_0/pulse_update_stable_cycle] [get_bd_pins power_fit_top/pulse_update_stable_cycle]
connect_bd_net [get_bd_pins cal_cdc_0/signal_mode_select] [get_bd_pins power_fit_top/signal_mode_select]
connect_bd_net [get_bd_ports clk] \
  [get_bd_pins system_ila_ch0/clk] [get_bd_pins agc_emu/clk] [get_bd_pins calibration/clk] [get_bd_pins in_band_flatness/clk] \
  [get_bd_pins power_fit_top/clk] [get_bd_pins axi_stream_combininp_0/clk] [get_bd_pins axis_iq_split_0/aclk] \
  [get_bd_pins axis_spliter_iq_0/aclk] [get_bd_pins gain_index_mux_0/clk] [get_bd_pins status_snapshot_0/clk] \
  [get_bd_pins axis_iq_bypass_0/aclk] [get_bd_pins axis_iq_source_mux_0/aclk] [get_bd_pins cal_cdc_0/clk]
connect_bd_net -net cw_power_calc_0_o_power_amp [get_bd_pins power_fit_top/power_amp] \
  [get_bd_pins system_ila_ch0/probe1] [get_bd_pins status_snapshot_0/power_amp]
connect_bd_net -net gain_index_mode_sel [get_bd_pins cal_cdc_0/gain_index_mode_sel] [get_bd_pins gain_index_mux_0/gain_index_mode_sel]
connect_bd_net [get_bd_pins gain_index_mux_0/gain_index_out] [get_bd_pins system_ila_ch0/probe0] [get_bd_pins calibration/gain_offset_index]
connect_bd_net [get_bd_ports over_range] [get_bd_pins agc_emu/over_range] [get_bd_pins status_snapshot_0/over_range]
connect_bd_net -net over_threshold1_1 [get_bd_ports over_threshold1] \
  [get_bd_pins agc_emu/over_threshold1] [get_bd_pins status_snapshot_0/over_threshold1]
connect_bd_net -net over_threshold2_1 [get_bd_ports over_threshold2] \
  [get_bd_pins agc_emu/over_threshold2] [get_bd_pins status_snapshot_0/over_threshold2]
connect_bd_net [get_bd_ports over_voltage] [get_bd_pins agc_emu/over_voltage] [get_bd_pins status_snapshot_0/over_voltage]
connect_bd_net [get_bd_pins power_fit_top/gain_index_power_fit] \
  [get_bd_pins agc_emu/gain_index_power_fit] [get_bd_pins status_snapshot_0/gain_index_power_fit]
connect_bd_net [get_bd_pins power_fit_top/goal_db] [get_bd_pins system_ila_ch0/probe2] [get_bd_pins status_snapshot_0/goal_db]
connect_bd_net [get_bd_pins power_fit_top/goal_rel_db] [get_bd_pins agc_emu/goal_rel_db] [get_bd_pins status_snapshot_0/goal_rel_db]
connect_bd_net [get_bd_ports pulse_avg_amp] [get_bd_pins power_fit_top/pulse_avg_amp]
connect_bd_net [get_bd_ports pulse_papr] [get_bd_pins power_fit_top/pulse_papr]
connect_bd_net -net reg_agc_bypass_agc [get_bd_pins addressable_reg_map/mem28] [get_bd_pins agc_emu/reg_bypass_agc]
connect_bd_net -net reg_agc_bypass_sr_update [get_bd_pins addressable_reg_map/mem30] [get_bd_pins agc_emu/reg_bypass_sr_update]
connect_bd_net -net reg_agc_bypass_tx_att_state [get_bd_pins addressable_reg_map/mem29] [get_bd_pins agc_emu/reg_bypass_tx_att_state]
connect_bd_net -net reg_agc_linear_mode_offset [get_bd_pins addressable_reg_map/mem34] [get_bd_pins agc_emu/reg_linear_mode_offset]
